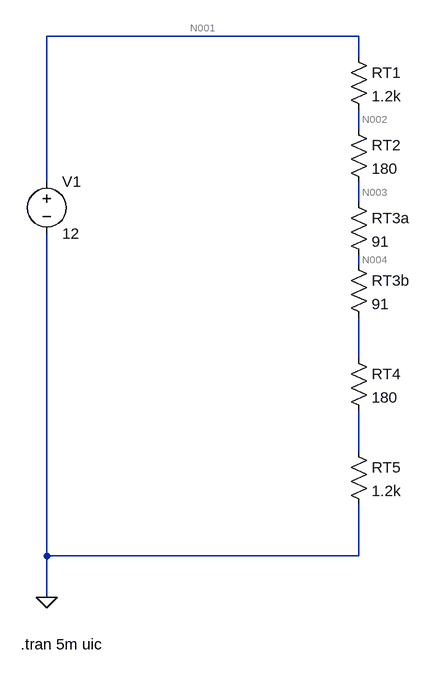
[diagram p0: schematic 3.5.asc]
3.5.asc, the LTspice schematic file:
Version 4.1
SHEET 1 880 952
WIRE 480 0 0 0
WIRE 480 32 480 0
WIRE 480 144 480 112
WIRE 0 224 0 0
WIRE 480 256 480 224
WIRE 480 352 480 336
WIRE 480 496 480 432
WIRE 480 640 480 576
WIRE 0 800 0 304
WIRE 480 800 480 720
WIRE 480 800 0 800
WIRE 0 864 0 800
FLAG 0 864 0
SYMBOL voltage 0 208 R0
WINDOW 123 0 0 Left 0
WINDOW 39 0 0 Left 0
SYMATTR InstName V1
SYMATTR Value 12
SYMBOL res 464 16 R0
SYMATTR InstName RT1
SYMATTR Value 1.2k
SYMBOL res 464 128 R0
SYMATTR InstName RT2
SYMATTR Value 180
SYMBOL res 464 240 R0
SYMATTR InstName RT3a
SYMATTR Value 91
SYMBOL res 464 336 R0
SYMATTR InstName RT3b
SYMATTR Value 91
SYMBOL res 464 480 R0
SYMATTR InstName RT4
SYMATTR Value 180
SYMBOL res 464 624 R0
SYMATTR InstName RT5
SYMATTR Value 1.2k
TEXT -40 936 Left 2 !.tran 5m uic

The netlist it stands for:
* 3.5.asc
V1 N001 0 12
RT1 N001 N002 1.2k
RT2 N002 N003 180
RT3a N003 N004 91
RT3b N004 N005 91
RT4 N005 N006 180
RT5 N006 0 1.2k
.tran 5m uic
.backanno
.end

* Results of the author's LTspice run, read from the files saved beside the schematic
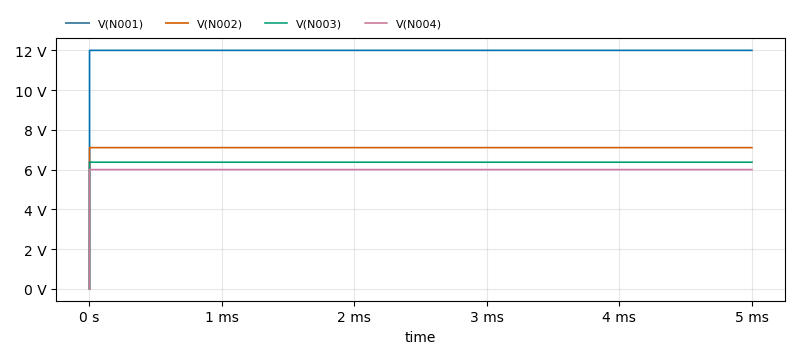
[diagram p1: Transient Analysis of 3.5.asc, plotted from the saved traces]
* Transient Analysis, 1 run:
*   V(N001): min 0 V, max 12 V, average 12 V, rms 12 V, last 12 V
*   V(N002): min 0 V, max 7.105 V, average 7.105 V, rms 7.105 V, last 7.105 V
*   V(N003): min 0 V, max 6.371 V, average 6.371 V, rms 6.371 V, last 6.371 V
*   V(N004): min 0 V, max 6 V, average 6 V, rms 6 V, last 6 V